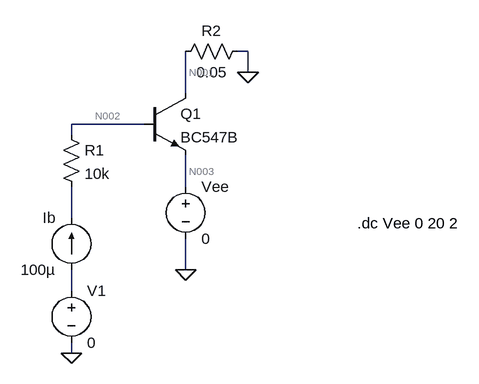
[diagram p0: schematic Draft1.asc]
Draft1.asc, the LTspice schematic file:
Version 4.1
SHEET 1 880 680
WIRE 256 -48 240 -48
WIRE 256 -16 256 -48
WIRE 160 16 160 -48
WIRE 96 64 -16 64
WIRE -16 80 -16 64
WIRE 160 160 160 112
WIRE -16 208 -16 160
WIRE 160 288 160 240
WIRE -16 320 -16 288
WIRE -16 416 -16 400
FLAG 256 -16 0
FLAG -16 416 0
FLAG 160 288 0
SYMBOL npn 96 16 R0
SYMATTR InstName Q1
SYMATTR Value BC547B
SYMBOL res -32 64 R0
SYMATTR InstName R1
SYMATTR Value 10k
SYMBOL current -16 288 R180
WINDOW 0 24 80 Left 2
WINDOW 3 24 0 Left 2
SYMATTR InstName Ib
SYMATTR Value 100µ
SYMBOL voltage -16 304 R0
SYMATTR InstName V1
SYMATTR Value 0
SYMBOL voltage 160 144 R0
SYMATTR InstName Vee
SYMATTR Value 0
SYMBOL res 256 -64 R90
WINDOW 0 0 56 VBottom 2
WINDOW 3 32 56 VTop 2
SYMATTR InstName R2
SYMATTR Value 0.05
TEXT 424 216 Left 2 !.dc Vee 0 20 2

The netlist it stands for:
* Draft1.asc
Q1 N001 N002 N003 0 BC547B
R1 N002 N004 10k
Ib N005 N004 100µ
V1 N005 0 0
Vee N003 0 0
R2 0 N001 0.05
.model NPN NPN
.model PNP PNP
.lib standard.bjt
.dc Vee 0 20 2
.backanno
.end

* Results of the author's LTspice run, read from the files saved beside the schematic
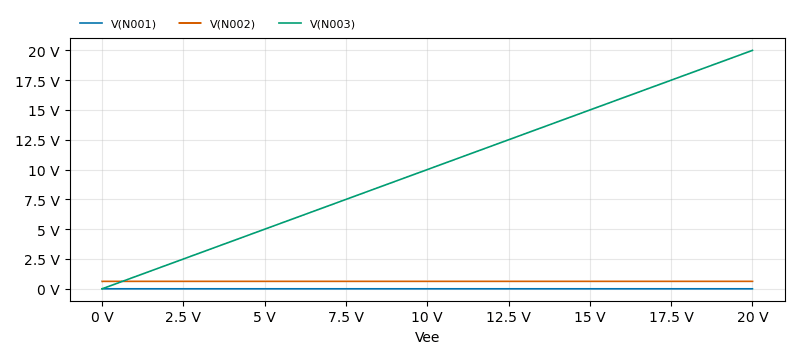
[diagram p1: DC transfer characteristic of Draft1.asc, plotted from the saved traces]
* DC transfer characteristic, 1 run:
*   V(N001): 7.534 µV at Vee=0 V, 61.98 µV at Vee=20 V, min 7.534 µV, max 61.98 µV
*   V(N002): 624 mV at Vee=0 V, 625.5 mV at Vee=20 V, min 624 mV, max 625.5 mV
*   V(N003): 0 V at Vee=0 V, 20 V at Vee=20 V, min 0 V, max 20 V